# Altium schematic sheet stm32.SchDoc
size 420 x 297 mm; SheetNumber: 1; SheetTotal: 2; Scale: 1:1; Разраб.: Прозоров; Обозначение документа: АНГМ.436437.001 Э3; Пров.: Ломака; Утв.: Татаринов; Наименование организации: ООО "Амаринго"; Перв. применение: АНГМ.436437.001 Э3; Наименование изделия 1: Контроллер заряда MPPT; Наименование изделия 2: Схема электрическая; Наименование изделия 3: принципиальная; Нач. отд.: Нач. отд.
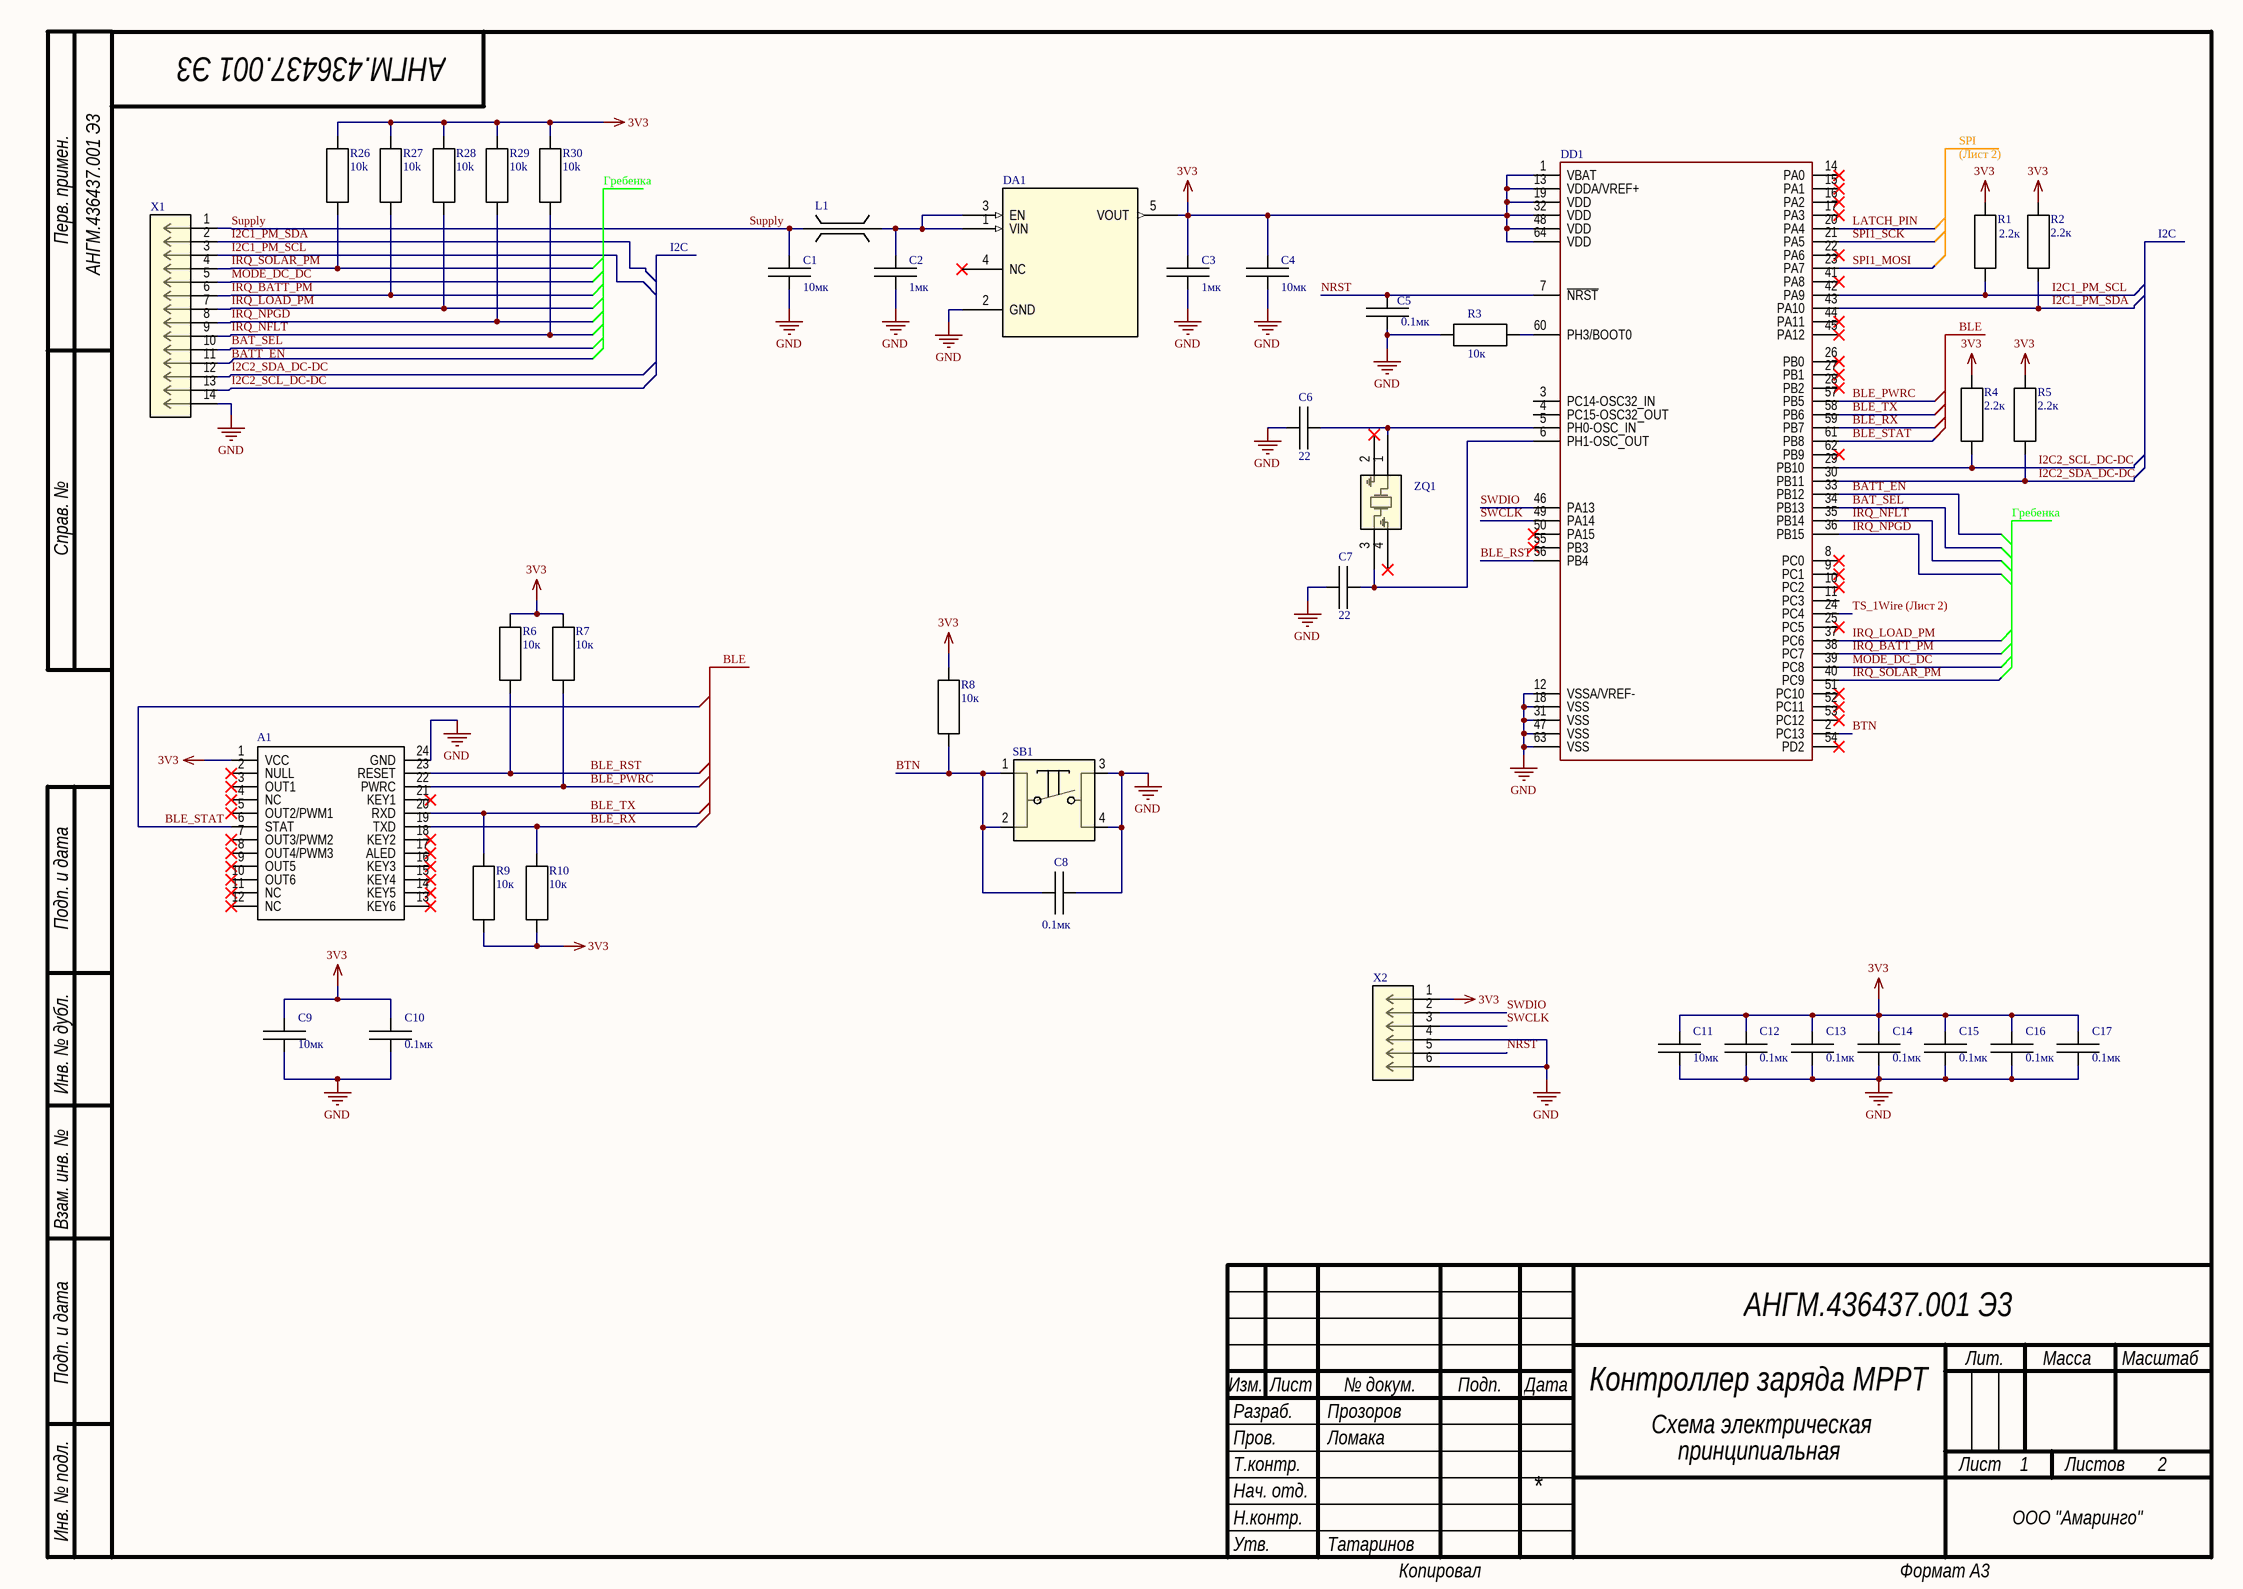
[diagram p0: stm32.SchDoc]

## Parts
A1  JDY-28M WAVGAT  [CAC-150P2011X1495-16N]  (value not drawn)
C1  value 10мк  [RES-0603N]  (hidden comment: TAJA106K016RNJ Kyocera AVX)
C2  value 1мк  [RES-0603N]  (hidden comment: GRM188R61E105KA12D Murata)
C3  value 1мк  [RES-0603N]  (hidden comment: GRM188R61E105KA12D Murata)
C4  TAJA106K016RNJ Kyocera AVX  [CAP-1206N]  (value not drawn)
C5  value 0.1мк  [RES-0603N]  (hidden comment: GRM188R71H104K Murata)
C6  value 22  [RES-0603N]  (hidden comment: CC0603FRNPO9BN220 Yageo)
C7  value 22  [RES-0603N]  (hidden comment: CC0603FRNPO9BN220 Yageo)
C8  value 0.1мк  [RES-0603N]  (hidden comment: GRM188R71H104K Murata)
C9  value 10мк  [CAP-1206N]  (hidden comment: TAJA106K016RNJ Kyocera AVX)
C10  value 0.1мк  [RES-0603N]  (hidden comment: GRM188R71H104K Murata)
C11  value 10мк  [CAP-1206N]  (hidden comment: TAJA106K016RNJ Kyocera AVX)
C12  value 0.1мк  [RES-0603N]  (hidden comment: GRM188R71H104K Murata)
C13  value 0.1мк  [RES-0603N]  (hidden comment: GRM188R71H104K Murata)
C14  value 0.1мк  [RES-0603N]  (hidden comment: GRM188R71H104K Murata)
C15  value 0.1мк  [RES-0603N]  (hidden comment: GRM188R71H104K Murata)
C16  value 0.1мк  [RES-0603N]  (hidden comment: GRM188R71H104K Murata)
C17  value 0.1мк  [RES-0603N]  (hidden comment: GRM188R71H104K Murata)
DA1  ADP150AUJZ-3.3-R7 Analog Devices  [UJ_5_ADI]  (value not drawn)
DD1  STM32L431RCT6 STMicroelectronics  [LQFP-64]  (value not drawn)
L1  BLM18AG601SN1D Murata Electronics  [FILTER_BLM18AG_MUR]  (value not drawn)
R1  value 2.2к  [RES-0603N]  (hidden comment: RC0603FR-072K2L Yageo)
R2  value 2.2к  [RES-0603N]  (hidden comment: RC0603FR-072K2L Yageo)
R3  value 10к  [RES-0603N]  (hidden comment: RC0603FR-0710KL Yageo)
R4  value 2.2к  [RES-0603N]  (hidden comment: RC0603FR-072K2L Yageo)
R5  value 2.2к  [RES-0603N]  (hidden comment: RC0603FR-072K2L Yageo)
R6  value 10к  [RES-0603N]  (hidden comment: RC0603FR-0710KL Yageo)
R7  value 10к  [RES-0603N]  (hidden comment: RC0603FR-0710KL Yageo)
R8  value 10к  [RES-0603N]  (hidden comment: RC0603FR-0710KL Yageo)
R9  value 10к  [RES-0603N]  (hidden comment: RC0603FR-0710KL Yageo)
R10  value 10к  [RES-0603N]  (hidden comment: RC0603FR-0710KL Yageo)
R26  value 10k  [RES-0603N]  (hidden comment: RC0603FR-0710KL Yageo)
R27  value 10k  [RES-0603N]  (hidden comment: RC0603FR-0710KL Yageo)
R28  value 10k  [RES-0603N]  (hidden comment: RC0603FR-0710KL Yageo)
R29  value 10k  [RES-0603N]  (hidden comment: RC0603FR-0710KL Yageo)
R30  value 10k  [RES-0603N]  (hidden comment: RC0603FR-0710KL Yageo)
SB1  KAN1211-1201B KAN  [SW4_PTS125SM432LFS_CNK]  (value not drawn)
X1  DS1021-2x7 Connfly  [CONN_215447-7_TEC]  (value not drawn)
X2  DS1022-1x6R Connfly  [CONN_2011-1X06G00SB_06P_OUP]  (value not drawn)
ZQ1  KSE-7I08000MAF343ZA3 KEEN SIDE  [C5S_5x3p2_SMD_AKR]  (value not drawn)

## Nets
3V3: A1.1(VCC) C3.2 C4.2 C9.2 C10.2 C11.2 C12.2 C13.2 C14.2 C15.2 C16.2 C17.2 DA1.5(VOUT) DD1.1(VBAT) DD1.13(VDDA/VREF+) DD1.19(VDD) DD1.32(VDD) DD1.48(VDD) DD1.64(VDD) R1.2 R2.2 R4.2 R5.2 R6.2 R7.2 R8.2 R9.1 R10.1 R26.2 R27.2 R28.2 R29.1 R30.1 X2.1
GND: A1.24(GND) C1.1 C2.1 C3.1 C4.1 C5.1 C6.1 C7.1 C8.2 C9.1 C10.1 C11.1 C12.1 C13.1 C14.1 C15.1 C16.1 C17.1 DA1.2(GND) DD1.12(VSSA/VREF-) DD1.18(VSS) DD1.31(VSS) DD1.47(VSS) DD1.63(VSS) R3.1 SB1.3 SB1.4 X1.14 X2.4 X2.6
BAT_SEL: DD1.34(PB13) X1.10
BATT_EN: DD1.33(PB12) X1.11
BLE_PWRC: A1.22(PWRC) DD1.57(PB5) R7.1
BLE_RST: A1.23(RESET) DD1.56(PB4) R6.1
BLE_RX: A1.19(TXD) DD1.59(PB7) R10.2
BLE_STAT: A1.6(STAT) DD1.61(PB8)
BLE_TX: A1.20(RXD) DD1.58(PB6) R9.2
BTN: C8.1 DD1.2(PC13) R8.1 SB1.1 SB1.2
I2C1_PM_SCL: DD1.42(PA9) R1.1 X1.3
I2C1_PM_SDA: DD1.43(PA10) R2.1 X1.2
I2C2_SCL_DC-DC: DD1.29(PB10) R4.1 X1.13
I2C2_SDA_DC-DC: DD1.30(PB11) R5.1 X1.12
IRQ_BATT_PM: DD1.38(PC7) R27.1 X1.6
IRQ_LOAD_PM: DD1.37(PC6) R28.1 X1.7
IRQ_NFLT: DD1.35(PB14) R30.2 X1.9
IRQ_NPGD: DD1.36(PB15) R29.2 X1.8
IRQ_SOLAR_PM: DD1.40(PC9) R26.1 X1.4
LATCH_PIN: DD1.20(PA4)
MODE_DC_DC: DD1.39(PC8) X1.5
NRST: C5.2 DD1.7(~{NRST}) X2.5
SPI1_MOSI: DD1.23(PA7)
SPI1_SCK: DD1.21(PA5)
Supply: C1.2 L1.1 X1.1
SWCLK: DD1.49(PA14) X2.3
SWDIO: DD1.46(PA13) X2.2
TS_1Wire: DD1.24(PC4)
NetC2_2: C2.2 DA1.1(VIN) DA1.3(EN) L1.2
NetC6_2: C6.2 DD1.5(PH0-OSC_IN) ZQ1.1(XTAL)
NetC7_2: C7.2 DD1.6(PH1-OSC_OUT) ZQ1.3(XTAL)
NetDD1_60: DD1.60(PH3/BOOT0) R3.2

Not connected (* = marked no-connect by the designer): A1 2(NULL)* 3(OUT1)* 4(NC)* 5(OUT2/PWM1)* 7(OUT3/PWM2)* 8(OUT4/PWM3)* 9(OUT5)* 10(OUT6)* 11(NC)* 12(NC)* 13(KEY6)* 14(KEY5)* 15(KEY4)* 16(KEY3)* 17(ALED)* 18(KEY2)* 21(KEY1)*; DA1 4(NC)*; DD1 3(PC14-OSC32_IN) 4(PC15-OSC32_OUT) 8(PC0)* 9(PC1)* 10(PC2)* 11(PC3) 14(PA0)* 15(PA1)* 16(PA2)* 17(PA3)* 22(PA6)* 25(PC5)* 26(PB0)* 27(PB1)* 28(PB2)* 41(PA8)* 44(PA11)* 45(PA12)* 50(PA15)* 51(PC10)* 52(PC11)* 53(PC12)* 54(PD2)* 55(PB3)* 62(PB9)*; ZQ1 2(GND)* 4(GND)*

## Notes on the sheet
- (near R30) Гребенка
- SPI
- (Лист 2)
- I2C
- BLE
- Гребенка
- Перв. примен.
- Справ. №
- Подп. и дата
- Инв. № дубл.
- Взам. инв. №
- Разраб.
- Изм.
- Лист
- № докум.
- Подп.
- Дата
- Лит.
- Масса
- Масштаб
- Пров.
- Т.контр.
- Листов
- Инв. № подл.
- Утв.
- Н.контр.
- Копировал
- Формат А3
- (in symbol CAP) 10мк

## Library data of the parts
A1 = JDY-28M: Group: Модуль; Name: JDY-28M WAVGAT
C1 C4 C9 C11 = CAP: Group: Конденсатор; Причечание: 10 мкФ - 16 В - тип A ±10% танталовый; Name: TAJA106K016RNJ Kyocera AVX
C2 C3 = CAP: Group: Конденсатор; Причечание: 1 мкФ - 25 В - X5R ±10%; Name: GRM188R61E105KA12D Murata
C5 C8 C10 C12-C17 = CAP: Group: Конденсатор; Причечание: 0.1 мкФ - 50 В - X7R ±10%; Name: GRM188R71H104K Murata
C6 C7 = CAP: Group: Конденсатор; Причечание: 22 пФ - 50 В - NP0 ±1%; Name: CC0603FRNPO9BN220 Yageo
DA1 = ADP150AUJZ-3.3-R7: Ultralow Noise, 150 mA CMOS Linear Regulator; Manufacturer_Name: Analog Devices Inc; Group: Микросхема; Причечание: Линейный стабилизатор 3.3В; Copyright: Copyright (C) 2025 Ultra Librarian. All rights reserved.; Manufacturer_Part_Number: ADP150AUJZ-3.3-R7; RefDes: RefDes; Type: Type; Name: ADP150AUJZ-3.3-R7 Analog Devices
DD1 = STM32L431RCT6: Group: Микросхема; Причечание: Микроконтроллер ARM 32-bit Cortex-M4; Name: STM32L431RCT6 STMicroelectronics
L1 = BLM18AG601SN1D: Group: Дроссель; Причечание: Дроссель подавления ЭМП 600 Ом, 0.5А; Name: BLM18AG601SN1D Murata Electronics
R1 R2 R4 R5 = RES: Group: Резистор; Причечание: 0.1 Вт - 2.2 кОм ±1%; Name: RC0603FR-072K2L Yageo
R3 R6-R10 R26-R30 = RES: Group: Резистор; Причечание: 0.1 Вт - 10 кОм ±1%; Name: RC0603FR-0710KL Yageo
SB1 = KAN1211-1201B: Manufacturer_Name: C&K Components; Manufacturer_Part_Number: PTS125SM432LFS; Group: Кнопка; Причечание: Кнопка тактовая 12x12x12 мм; Copyright: Copyright (C) 2025 Ultra Librarian. All rights reserved.; Name: KAN1211-1201B KAN
X1 = 215447-7: 2x7 POS AMPMODU MOD II HDR ACTION PIN; Manufacturer_Name: TE Connectivity; Group: Вилка; Причечание: Вилка штыревая прямая 2.54мм 2x7 pin; Copyright: Copyright (C) 2025 Ultra Librarian. All rights reserved.; Manufacturer_Part_Number: 215447-7; RefDes: RefDes; Type: Type; Name: DS1021-2x7 Connfly
X2 = 2011-1X06G00SB: KLS1-207-1-06-S, Вилка штыревая 2.54мм 1x6 угловая; Manufacturer_Name: Oupiin; Причечание: Вилка штыревая угловая 2.54мм 1x6 pin; Copyright: Copyright (C) 2025 Ultra Librarian. All rights reserved.; Manufacturer_Part_Number: 2011-1X06G00SB; RefDes: RefDes; Type: Type; Group: Вилка; Name: DS1022-1x6R Connfly
ZQ1 = C5S-8.000-18-3030-X-R: KSE-7I08000MAF343ZA3; Manufacturer_Name: Aker; Group: Резонатор; Copyright: Copyright (C) 2025 Ultra Librarian. All rights reserved.; Manufacturer_Part_Number: C5S-8.000-18-3030-X-R; RefDes: RefDes; Type: Type; Name: KSE-7I08000MAF343ZA3 KEEN SIDE